# Altium schematic sheet Top-Sheet.SchDoc
size 420 x 297 mm; SheetNumber: 1; SheetTotal: 15
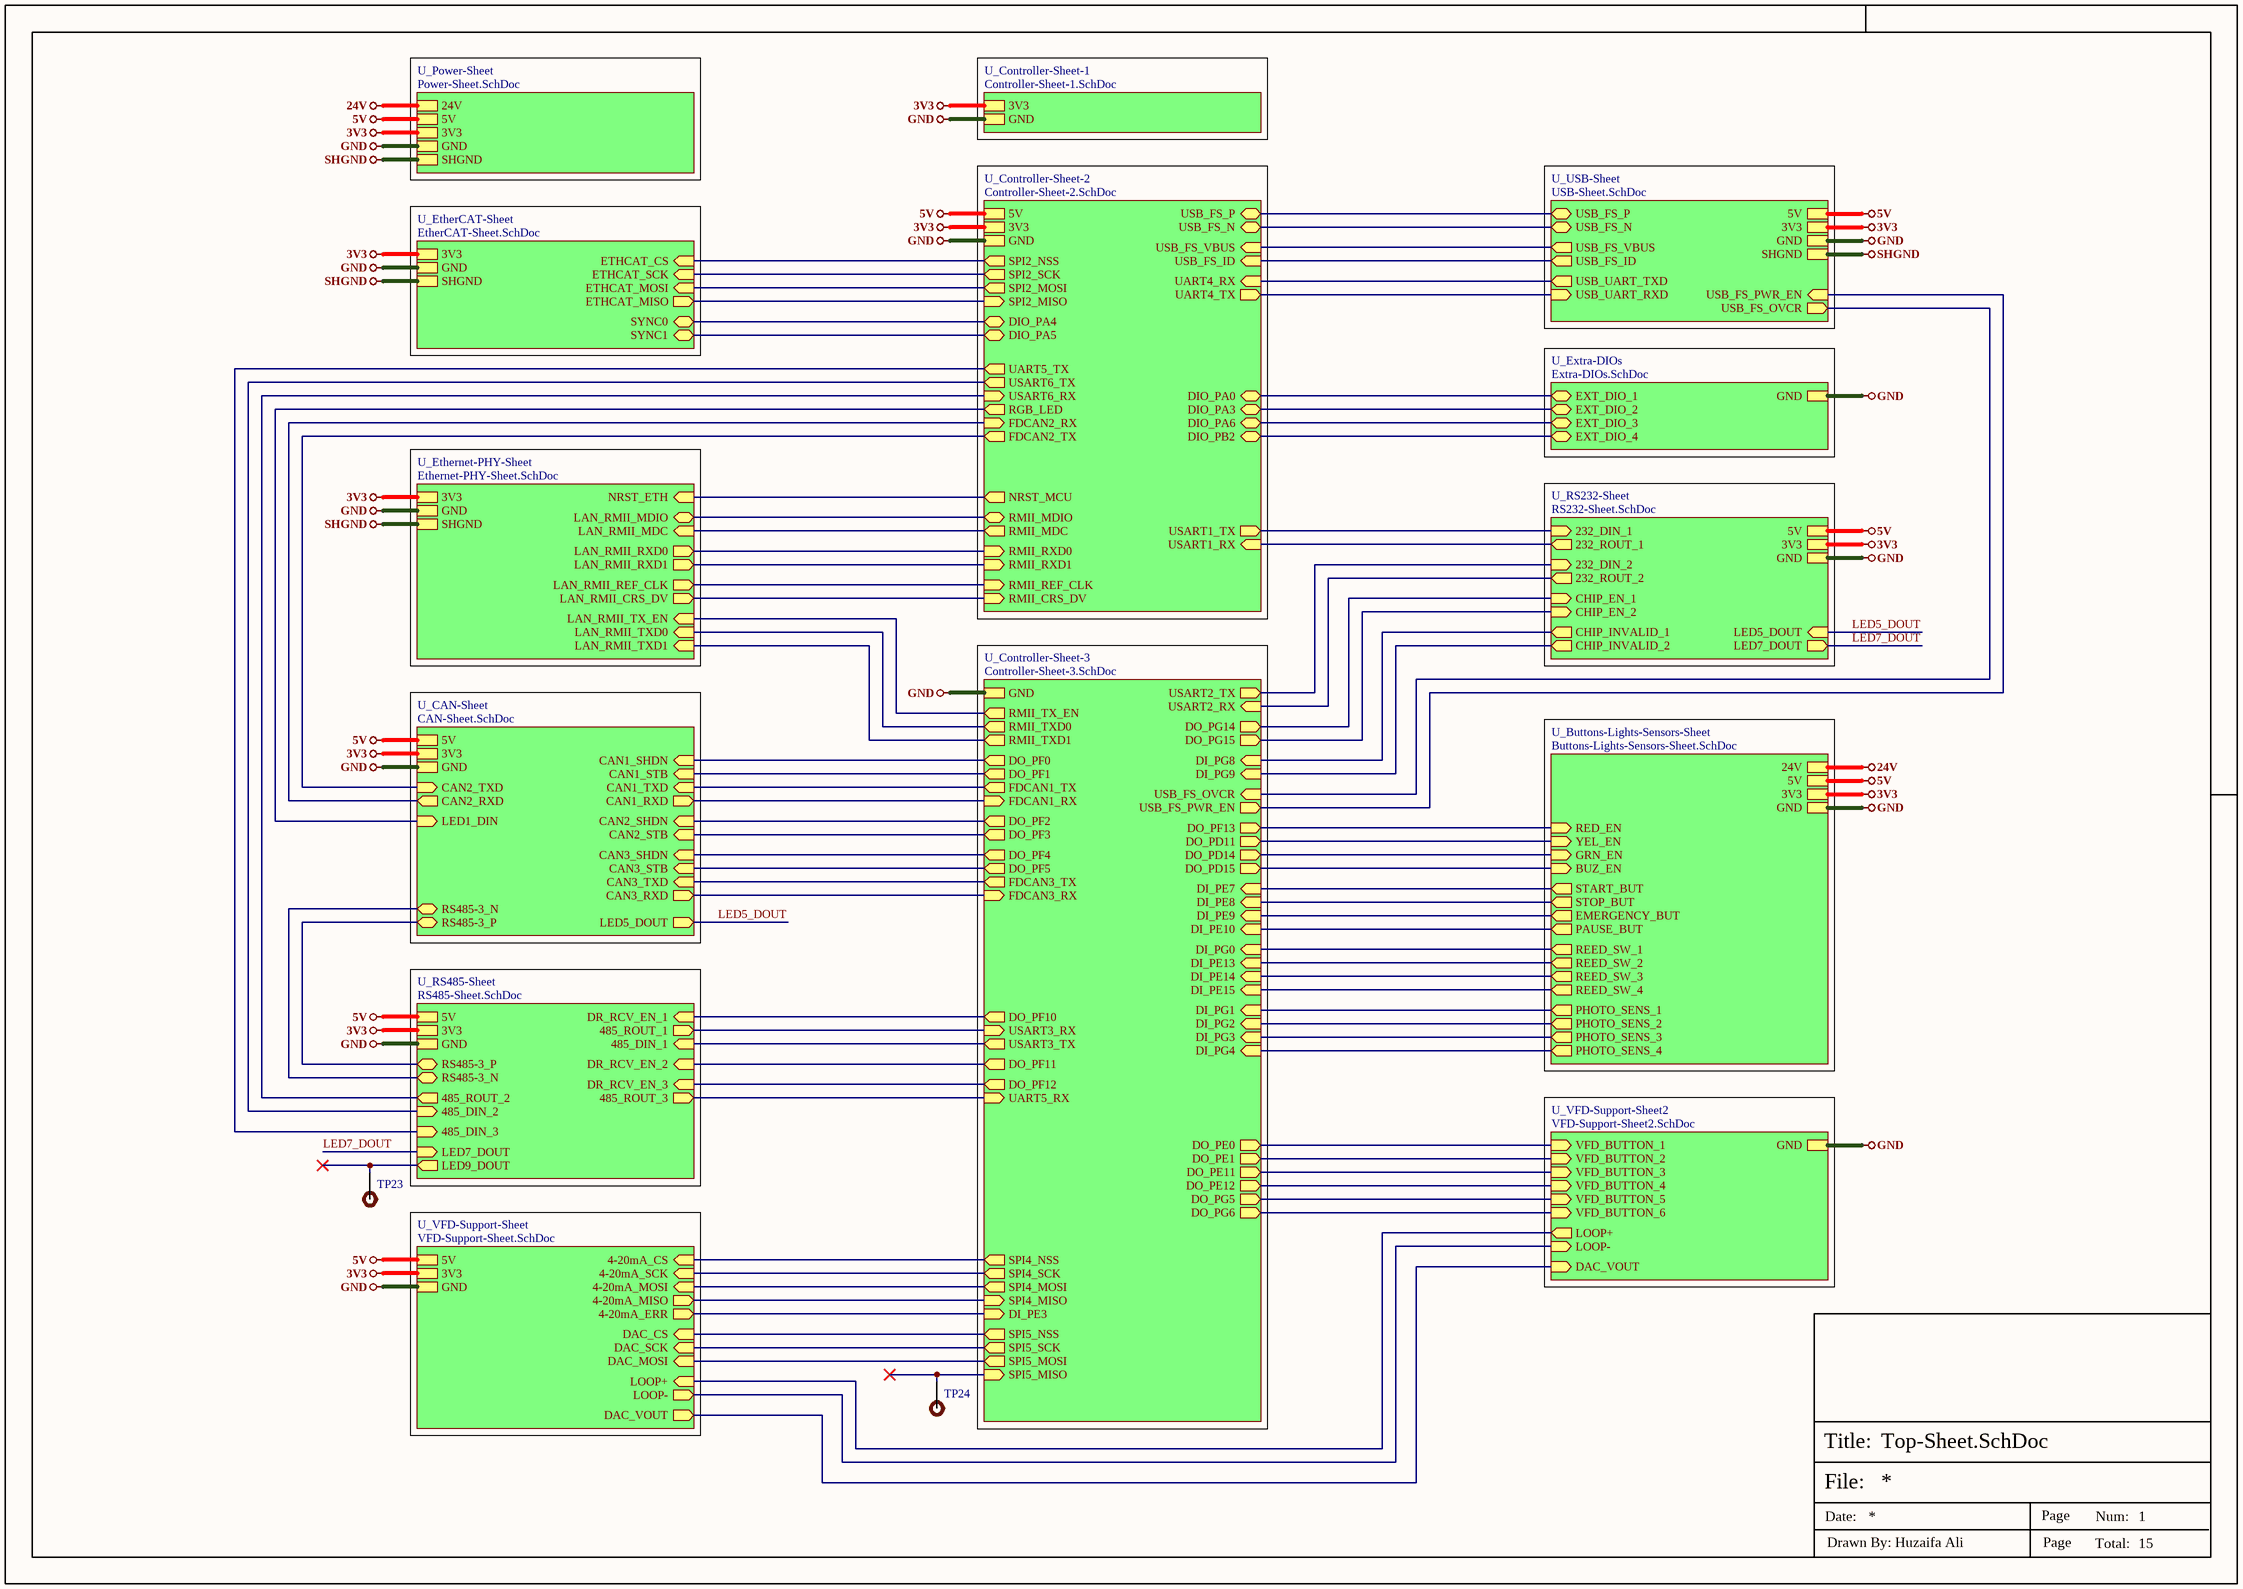
[diagram p0: Top-Sheet.SchDoc]

## Parts
TP23  TEST POINT 0.5mm Dia  [Test-point - 0.5mm]  (value not drawn)  (no BOM)
TP24  TEST POINT 0.5mm Dia  [Test-point - 0.5mm]  (value not drawn)  (no BOM)

## Sub-sheets
U_Buttons-Lights-Sensors-Sheet = Buttons-Lights-Sensors-Sheet.SchDoc: GND, 3V3, 5V, 24V, BUZ_EN (in), GRN_EN (in), RED_EN (in), YEL_EN (in), STOP_BUT (out), EMERGENCY_BUT (out), PAUSE_BUT (out), START_BUT (out), REED_SW_3 (out), REED_SW_1 (out), REED_SW_4 (out), REED_SW_2 (out), PHOTO_SENS_3 (out), PHOTO_SENS_1 (out), PHOTO_SENS_4 (out), PHOTO_SENS_2 (out)
U_CAN-Sheet = CAN-Sheet.SchDoc: GND, 3V3, 5V, CAN1_STB (in), CAN1_TXD (in), CAN1_RXD (out), CAN1_SHDN (in), CAN2_STB (in), CAN2_TXD (in), CAN2_RXD (out), CAN2_SHDN (in), CAN3_STB (in), CAN3_TXD (in), CAN3_RXD (out), CAN3_SHDN (in), LED1_DIN (in), LED5_DOUT (out), RS485-3_N (bidir), RS485-3_P (bidir)
U_Controller-Sheet-1 = Controller-Sheet-1.SchDoc: GND, 3V3
U_Controller-Sheet-2 = Controller-Sheet-2.SchDoc: GND, 3V3, 5V, RMII_REF_CLK (in), RMII_MDIO (bidir), RMII_CRS_DV (in), FDCAN2_RX (in), RMII_MDC (out), RMII_RXD0 (in), RMII_RXD1 (in), USB_FS_VBUS (in), USB_FS_ID (in), USB_FS_N (bidir), USB_FS_P (bidir), USART6_TX (out), USART6_RX (in), UART4_TX (out), UART4_RX (in), UART5_TX (out), NRST_MCU (out), USART1_TX (out), USART1_RX (in), SPI2_SCK (out), SPI2_NSS (out), FDCAN2_TX (out), SPI2_MISO (in), SPI2_MOSI (out), DIO_PA0 (bidir), DIO_PA3 (bidir), DIO_PA4 (bidir), DIO_PA5 (bidir), DIO_PA6 (bidir), DIO_PB2 (bidir), RGB_LED (out)
U_Controller-Sheet-3 = Controller-Sheet-3.SchDoc: GND, FDCAN1_RX (in), FDCAN1_TX (out), UART5_RX (in), USART2_TX (out), USART2_RX (in), USART3_TX (out), USART3_RX (in), USB_FS_PWR_EN (out), FDCAN3_RX (in), FDCAN3_TX (out), RMII_TX_EN (out), RMII_TXD1 (out), RMII_TXD0 (out), USB_FS_OVCR (in), DO_PE0 (out), DO_PE1 (out), DI_PE3 (in), DI_PE7 (in), DI_PE8 (in), DI_PE9 (in), DI_PE10 (in), DO_PE11 (out), DO_PE12 (out), DI_PE13 (in), DI_PE14 (in), DI_PE15 (in), DI_PG0 (in), DI_PG1 (in), DI_PG2 (in), DI_PG3 (in), DI_PG4 (in), DO_PG5 (out), DO_PG6 (out), DI_PG8 (in), DI_PG9 (in), SPI4_SCK (out), SPI4_NSS (out), SPI4_MISO (in), SPI4_MOSI (out), DO_PD11 (out), DO_PD14 (out), DO_PD15 (out), DO_PF0 (out), DO_PF1 (out), DO_PF2 (out), DO_PF3 (out), DO_PF4 (out), DO_PF5 (out), DO_PF10 (out), DO_PF11 (out), DO_PF12 (out), DO_PF13 (out), DO_PG14 (out), DO_PG15 (out), SPI5_NSS (out), SPI5_SCK (out), SPI5_MISO (in), SPI5_MOSI (out)
U_EtherCAT-Sheet = EtherCAT-Sheet.SchDoc: GND, 3V3, SHGND, ETHCAT_SCK (in), ETHCAT_CS (in), ETHCAT_MISO (out), ETHCAT_MOSI (in), SYNC1 (bidir), SYNC0 (bidir)
U_Ethernet-PHY-Sheet = Ethernet-PHY-Sheet.SchDoc: GND, 3V3, SHGND, LAN_RMII_TX_EN (in), LAN_RMII_TXD1 (in), LAN_RMII_TXD0 (in), LAN_RMII_RXD0 (out), LAN_RMII_RXD1 (out), LAN_RMII_CRS_DV (out), LAN_RMII_MDIO (bidir), LAN_RMII_MDC (in), LAN_RMII_REF_CLK (out), NRST_ETH (in)
U_Extra-DIOs = Extra-DIOs.SchDoc: GND, EXT_DIO_1 (bidir), EXT_DIO_2 (bidir), EXT_DIO_3 (bidir), EXT_DIO_4 (bidir)
U_Power-Sheet = Power-Sheet.SchDoc: GND, 3V3, 5V, 24V, SHGND
U_RS232-Sheet = RS232-Sheet.SchDoc: GND, 3V3, 5V, 232_DIN_1 (in), 232_ROUT_1 (out), CHIP_EN_1 (in), CHIP_INVALID_1 (out), 232_DIN_2 (in), 232_ROUT_2 (out), CHIP_EN_2 (in), CHIP_INVALID_2 (out), LED5_DOUT (in), LED7_DOUT (out)
U_RS485-Sheet = RS485-Sheet.SchDoc: GND, 3V3, 5V, DR_RCV_EN_1 (in), 485_ROUT_1 (out), 485_DIN_1 (in), DR_RCV_EN_2 (in), 485_ROUT_2 (out), 485_DIN_2 (in), DR_RCV_EN_3 (in), 485_ROUT_3 (out), 485_DIN_3 (in), LED7_DOUT (in), LED9_DOUT (out), RS485-3_N (bidir), RS485-3_P (bidir)
U_USB-Sheet = USB-Sheet.SchDoc: GND, 3V3, 5V, SHGND, USB_FS_PWR_EN (in), USB_FS_OVCR (out), USB_FS_VBUS (out), USB_FS_ID (out), USB_FS_N (bidir), USB_FS_P (bidir), USB_UART_RXD (in), USB_UART_TXD (out)
U_VFD-Support-Sheet = VFD-Support-Sheet.SchDoc: GND, 3V3, 5V, 4-20mA_SCK (in), 4-20mA_CS (in), 4-20mA_MISO (out), 4-20mA_MOSI (in), DAC_SCK (in), DAC_CS (in), DAC_MOSI (in), LOOP+ (in), LOOP- (out), DAC_VOUT (out), 4-20mA_ERR (out)
U_VFD-Support-Sheet2 = VFD-Support-Sheet2.SchDoc: GND, LOOP+ (out), LOOP- (in), DAC_VOUT (in), VFD_BUTTON_1 (in), VFD_BUTTON_2 (in), VFD_BUTTON_3 (in), VFD_BUTTON_4 (in), VFD_BUTTON_5 (in), VFD_BUTTON_6 (in)

## Nets
3V3: sheet U_Power-Sheet/3V3, sheet U_Controller-Sheet-1/3V3, sheet U_Controller-Sheet-2/3V3, sheet U_Ethernet-PHY-Sheet/3V3, sheet U_USB-Sheet/3V3, sheet U_CAN-Sheet/3V3, sheet U_RS485-Sheet/3V3, sheet U_RS232-Sheet/3V3, sheet U_EtherCAT-Sheet/3V3, sheet U_Buttons-Lights-Sensors-Sheet/3V3, sheet U_VFD-Support-Sheet/3V3
5V: sheet U_Power-Sheet/5V, sheet U_Controller-Sheet-2/5V, sheet U_USB-Sheet/5V, sheet U_CAN-Sheet/5V, sheet U_RS485-Sheet/5V, sheet U_RS232-Sheet/5V, sheet U_Buttons-Lights-Sensors-Sheet/5V, sheet U_VFD-Support-Sheet/5V
24V: sheet U_Power-Sheet/24V, sheet U_Buttons-Lights-Sensors-Sheet/24V
GND: sheet U_Power-Sheet/GND, sheet U_Controller-Sheet-1/GND, sheet U_Controller-Sheet-2/GND, sheet U_Controller-Sheet-3/GND, sheet U_Ethernet-PHY-Sheet/GND, sheet U_USB-Sheet/GND, sheet U_CAN-Sheet/GND, sheet U_RS485-Sheet/GND, sheet U_RS232-Sheet/GND, sheet U_EtherCAT-Sheet/GND, sheet U_Extra-DIOs/GND, sheet U_Buttons-Lights-Sensors-Sheet/GND, sheet U_VFD-Support-Sheet/GND, sheet U_VFD-Support-Sheet2/GND
SHGND: sheet U_Power-Sheet/SHGND, sheet U_Ethernet-PHY-Sheet/SHGND, sheet U_USB-Sheet/SHGND, sheet U_EtherCAT-Sheet/SHGND
LED5_DOUT: sheet U_CAN-Sheet/LED5_DOUT, sheet U_RS232-Sheet/LED5_DOUT
LED7_DOUT: sheet U_RS485-Sheet/LED7_DOUT, sheet U_RS232-Sheet/LED7_DOUT
NetTP23_1: TP23.1 ; sheet U_RS485-Sheet/LED9_DOUT
NetTP24_1: TP24.1 ; sheet U_Controller-Sheet-3/SPI5_MISO
(unnamed): sheet U_Controller-Sheet-2/RMII_REF_CLK, sheet U_Ethernet-PHY-Sheet/LAN_RMII_REF_CLK
(unnamed): sheet U_Controller-Sheet-2/RMII_MDIO, sheet U_Ethernet-PHY-Sheet/LAN_RMII_MDIO
(unnamed): sheet U_Controller-Sheet-2/RMII_CRS_DV, sheet U_Ethernet-PHY-Sheet/LAN_RMII_CRS_DV
(unnamed): sheet U_Controller-Sheet-2/FDCAN2_RX, sheet U_CAN-Sheet/CAN2_RXD
(unnamed): sheet U_Controller-Sheet-2/RMII_MDC, sheet U_Ethernet-PHY-Sheet/LAN_RMII_MDC
(unnamed): sheet U_Controller-Sheet-2/RMII_RXD0, sheet U_Ethernet-PHY-Sheet/LAN_RMII_RXD0
(unnamed): sheet U_Controller-Sheet-2/RMII_RXD1, sheet U_Ethernet-PHY-Sheet/LAN_RMII_RXD1
(unnamed): sheet U_Controller-Sheet-2/USB_FS_VBUS, sheet U_USB-Sheet/USB_FS_VBUS
(unnamed): sheet U_Controller-Sheet-2/USB_FS_ID, sheet U_USB-Sheet/USB_FS_ID
(unnamed): sheet U_Controller-Sheet-2/USB_FS_N, sheet U_USB-Sheet/USB_FS_N
(unnamed): sheet U_Controller-Sheet-2/USB_FS_P, sheet U_USB-Sheet/USB_FS_P
(unnamed): sheet U_Controller-Sheet-2/USART6_TX, sheet U_RS485-Sheet/485_DIN_2
(unnamed): sheet U_Controller-Sheet-2/USART6_RX, sheet U_RS485-Sheet/485_ROUT_2
(unnamed): sheet U_Controller-Sheet-2/UART4_TX, sheet U_USB-Sheet/USB_UART_RXD
(unnamed): sheet U_Controller-Sheet-2/UART4_RX, sheet U_USB-Sheet/USB_UART_TXD
(unnamed): sheet U_Controller-Sheet-2/UART5_TX, sheet U_RS485-Sheet/485_DIN_3
(unnamed): sheet U_Controller-Sheet-2/NRST_MCU, sheet U_Ethernet-PHY-Sheet/NRST_ETH
(unnamed): sheet U_Controller-Sheet-2/USART1_TX, sheet U_RS232-Sheet/232_DIN_1
(unnamed): sheet U_Controller-Sheet-2/USART1_RX, sheet U_RS232-Sheet/232_ROUT_1
(unnamed): sheet U_Controller-Sheet-2/SPI2_SCK, sheet U_EtherCAT-Sheet/ETHCAT_SCK
(unnamed): sheet U_Controller-Sheet-2/SPI2_NSS, sheet U_EtherCAT-Sheet/ETHCAT_CS
(unnamed): sheet U_Controller-Sheet-2/FDCAN2_TX, sheet U_CAN-Sheet/CAN2_TXD
(unnamed): sheet U_Controller-Sheet-2/SPI2_MISO, sheet U_EtherCAT-Sheet/ETHCAT_MISO
(unnamed): sheet U_Controller-Sheet-2/SPI2_MOSI, sheet U_EtherCAT-Sheet/ETHCAT_MOSI
(unnamed): sheet U_Controller-Sheet-2/DIO_PA0, sheet U_Extra-DIOs/EXT_DIO_1
(unnamed): sheet U_Controller-Sheet-2/DIO_PA3, sheet U_Extra-DIOs/EXT_DIO_2
(unnamed): sheet U_Controller-Sheet-2/DIO_PA4, sheet U_EtherCAT-Sheet/SYNC0
(unnamed): sheet U_Controller-Sheet-2/DIO_PA5, sheet U_EtherCAT-Sheet/SYNC1
(unnamed): sheet U_Controller-Sheet-2/DIO_PA6, sheet U_Extra-DIOs/EXT_DIO_3
(unnamed): sheet U_Controller-Sheet-2/DIO_PB2, sheet U_Extra-DIOs/EXT_DIO_4
(unnamed): sheet U_Controller-Sheet-2/RGB_LED, sheet U_CAN-Sheet/LED1_DIN
(unnamed): sheet U_Controller-Sheet-3/FDCAN1_RX, sheet U_CAN-Sheet/CAN1_RXD
(unnamed): sheet U_Controller-Sheet-3/FDCAN1_TX, sheet U_CAN-Sheet/CAN1_TXD
(unnamed): sheet U_Controller-Sheet-3/UART5_RX, sheet U_RS485-Sheet/485_ROUT_3
(unnamed): sheet U_Controller-Sheet-3/USART2_TX, sheet U_RS232-Sheet/232_DIN_2
(unnamed): sheet U_Controller-Sheet-3/USART2_RX, sheet U_RS232-Sheet/232_ROUT_2
(unnamed): sheet U_Controller-Sheet-3/USART3_TX, sheet U_RS485-Sheet/485_DIN_1
(unnamed): sheet U_Controller-Sheet-3/USART3_RX, sheet U_RS485-Sheet/485_ROUT_1
(unnamed): sheet U_Controller-Sheet-3/USB_FS_PWR_EN, sheet U_USB-Sheet/USB_FS_PWR_EN
(unnamed): sheet U_Controller-Sheet-3/FDCAN3_RX, sheet U_CAN-Sheet/CAN3_RXD
(unnamed): sheet U_Controller-Sheet-3/FDCAN3_TX, sheet U_CAN-Sheet/CAN3_TXD
(unnamed): sheet U_Controller-Sheet-3/RMII_TX_EN, sheet U_Ethernet-PHY-Sheet/LAN_RMII_TX_EN
(unnamed): sheet U_Controller-Sheet-3/RMII_TXD1, sheet U_Ethernet-PHY-Sheet/LAN_RMII_TXD1
(unnamed): sheet U_Controller-Sheet-3/RMII_TXD0, sheet U_Ethernet-PHY-Sheet/LAN_RMII_TXD0
(unnamed): sheet U_Controller-Sheet-3/USB_FS_OVCR, sheet U_USB-Sheet/USB_FS_OVCR
(unnamed): sheet U_Controller-Sheet-3/DO_PE0, sheet U_VFD-Support-Sheet2/VFD_BUTTON_1
(unnamed): sheet U_Controller-Sheet-3/DO_PE1, sheet U_VFD-Support-Sheet2/VFD_BUTTON_2
(unnamed): sheet U_Controller-Sheet-3/DI_PE3, sheet U_VFD-Support-Sheet/4-20mA_ERR
(unnamed): sheet U_Controller-Sheet-3/DI_PE7, sheet U_Buttons-Lights-Sensors-Sheet/START_BUT
(unnamed): sheet U_Controller-Sheet-3/DI_PE8, sheet U_Buttons-Lights-Sensors-Sheet/STOP_BUT
(unnamed): sheet U_Controller-Sheet-3/DI_PE9, sheet U_Buttons-Lights-Sensors-Sheet/EMERGENCY_BUT
(unnamed): sheet U_Controller-Sheet-3/DI_PE10, sheet U_Buttons-Lights-Sensors-Sheet/PAUSE_BUT
(unnamed): sheet U_Controller-Sheet-3/DO_PE11, sheet U_VFD-Support-Sheet2/VFD_BUTTON_3
(unnamed): sheet U_Controller-Sheet-3/DO_PE12, sheet U_VFD-Support-Sheet2/VFD_BUTTON_4
(unnamed): sheet U_Controller-Sheet-3/DI_PE13, sheet U_Buttons-Lights-Sensors-Sheet/REED_SW_2
(unnamed): sheet U_Controller-Sheet-3/DI_PE14, sheet U_Buttons-Lights-Sensors-Sheet/REED_SW_3
(unnamed): sheet U_Controller-Sheet-3/DI_PE15, sheet U_Buttons-Lights-Sensors-Sheet/REED_SW_4
(unnamed): sheet U_Controller-Sheet-3/DI_PG0, sheet U_Buttons-Lights-Sensors-Sheet/REED_SW_1
(unnamed): sheet U_Controller-Sheet-3/DI_PG1, sheet U_Buttons-Lights-Sensors-Sheet/PHOTO_SENS_1
(unnamed): sheet U_Controller-Sheet-3/DI_PG2, sheet U_Buttons-Lights-Sensors-Sheet/PHOTO_SENS_2
(unnamed): sheet U_Controller-Sheet-3/DI_PG3, sheet U_Buttons-Lights-Sensors-Sheet/PHOTO_SENS_3
(unnamed): sheet U_Controller-Sheet-3/DI_PG4, sheet U_Buttons-Lights-Sensors-Sheet/PHOTO_SENS_4
(unnamed): sheet U_Controller-Sheet-3/DO_PG5, sheet U_VFD-Support-Sheet2/VFD_BUTTON_5
(unnamed): sheet U_Controller-Sheet-3/DO_PG6, sheet U_VFD-Support-Sheet2/VFD_BUTTON_6
(unnamed): sheet U_Controller-Sheet-3/DI_PG8, sheet U_RS232-Sheet/CHIP_INVALID_1
(unnamed): sheet U_Controller-Sheet-3/DI_PG9, sheet U_RS232-Sheet/CHIP_INVALID_2
(unnamed): sheet U_Controller-Sheet-3/SPI4_SCK, sheet U_VFD-Support-Sheet/4-20mA_SCK
(unnamed): sheet U_Controller-Sheet-3/SPI4_NSS, sheet U_VFD-Support-Sheet/4-20mA_CS
(unnamed): sheet U_Controller-Sheet-3/SPI4_MISO, sheet U_VFD-Support-Sheet/4-20mA_MISO
(unnamed): sheet U_Controller-Sheet-3/SPI4_MOSI, sheet U_VFD-Support-Sheet/4-20mA_MOSI
(unnamed): sheet U_Controller-Sheet-3/DO_PD11, sheet U_Buttons-Lights-Sensors-Sheet/YEL_EN
(unnamed): sheet U_Controller-Sheet-3/DO_PD14, sheet U_Buttons-Lights-Sensors-Sheet/GRN_EN
(unnamed): sheet U_Controller-Sheet-3/DO_PD15, sheet U_Buttons-Lights-Sensors-Sheet/BUZ_EN
(unnamed): sheet U_Controller-Sheet-3/DO_PF0, sheet U_CAN-Sheet/CAN1_SHDN
(unnamed): sheet U_Controller-Sheet-3/DO_PF1, sheet U_CAN-Sheet/CAN1_STB
(unnamed): sheet U_Controller-Sheet-3/DO_PF2, sheet U_CAN-Sheet/CAN2_SHDN
(unnamed): sheet U_Controller-Sheet-3/DO_PF3, sheet U_CAN-Sheet/CAN2_STB
(unnamed): sheet U_Controller-Sheet-3/DO_PF4, sheet U_CAN-Sheet/CAN3_SHDN
(unnamed): sheet U_Controller-Sheet-3/DO_PF5, sheet U_CAN-Sheet/CAN3_STB
(unnamed): sheet U_Controller-Sheet-3/DO_PF10, sheet U_RS485-Sheet/DR_RCV_EN_1
(unnamed): sheet U_Controller-Sheet-3/DO_PF11, sheet U_RS485-Sheet/DR_RCV_EN_2
(unnamed): sheet U_Controller-Sheet-3/DO_PF12, sheet U_RS485-Sheet/DR_RCV_EN_3
(unnamed): sheet U_Controller-Sheet-3/DO_PF13, sheet U_Buttons-Lights-Sensors-Sheet/RED_EN
(unnamed): sheet U_Controller-Sheet-3/DO_PG14, sheet U_RS232-Sheet/CHIP_EN_1
(unnamed): sheet U_Controller-Sheet-3/DO_PG15, sheet U_RS232-Sheet/CHIP_EN_2
(unnamed): sheet U_Controller-Sheet-3/SPI5_NSS, sheet U_VFD-Support-Sheet/DAC_CS
(unnamed): sheet U_Controller-Sheet-3/SPI5_SCK, sheet U_VFD-Support-Sheet/DAC_SCK
(unnamed): sheet U_Controller-Sheet-3/SPI5_MOSI, sheet U_VFD-Support-Sheet/DAC_MOSI
(unnamed): sheet U_CAN-Sheet/RS485-3_N, sheet U_RS485-Sheet/RS485-3_N
(unnamed): sheet U_CAN-Sheet/RS485-3_P, sheet U_RS485-Sheet/RS485-3_P
(unnamed): sheet U_VFD-Support-Sheet/LOOP+, sheet U_VFD-Support-Sheet2/LOOP+
(unnamed): sheet U_VFD-Support-Sheet/LOOP-, sheet U_VFD-Support-Sheet2/LOOP-
(unnamed): sheet U_VFD-Support-Sheet/DAC_VOUT, sheet U_VFD-Support-Sheet2/DAC_VOUT

## Notes on the sheet
- File:
- Title:
- Date:
- Page
- Num:
- Total:
- Drawn By: Huzaifa Ali

## Library data of the parts
TP23 TP24 = TEST POINT 0.5mm Dia: Test Point ON; Item Type: Test Point; Manufacturer Part Number: TEST POINT 0.5mm Dia